# EasyEDA schematic SCH_water_2026-10-04.json
TITLE: Sheet_1; REV: 1.0; Date: 2026-01-22; Sheet: 1/1; Drawn By: asfadfs; Company: Your Company
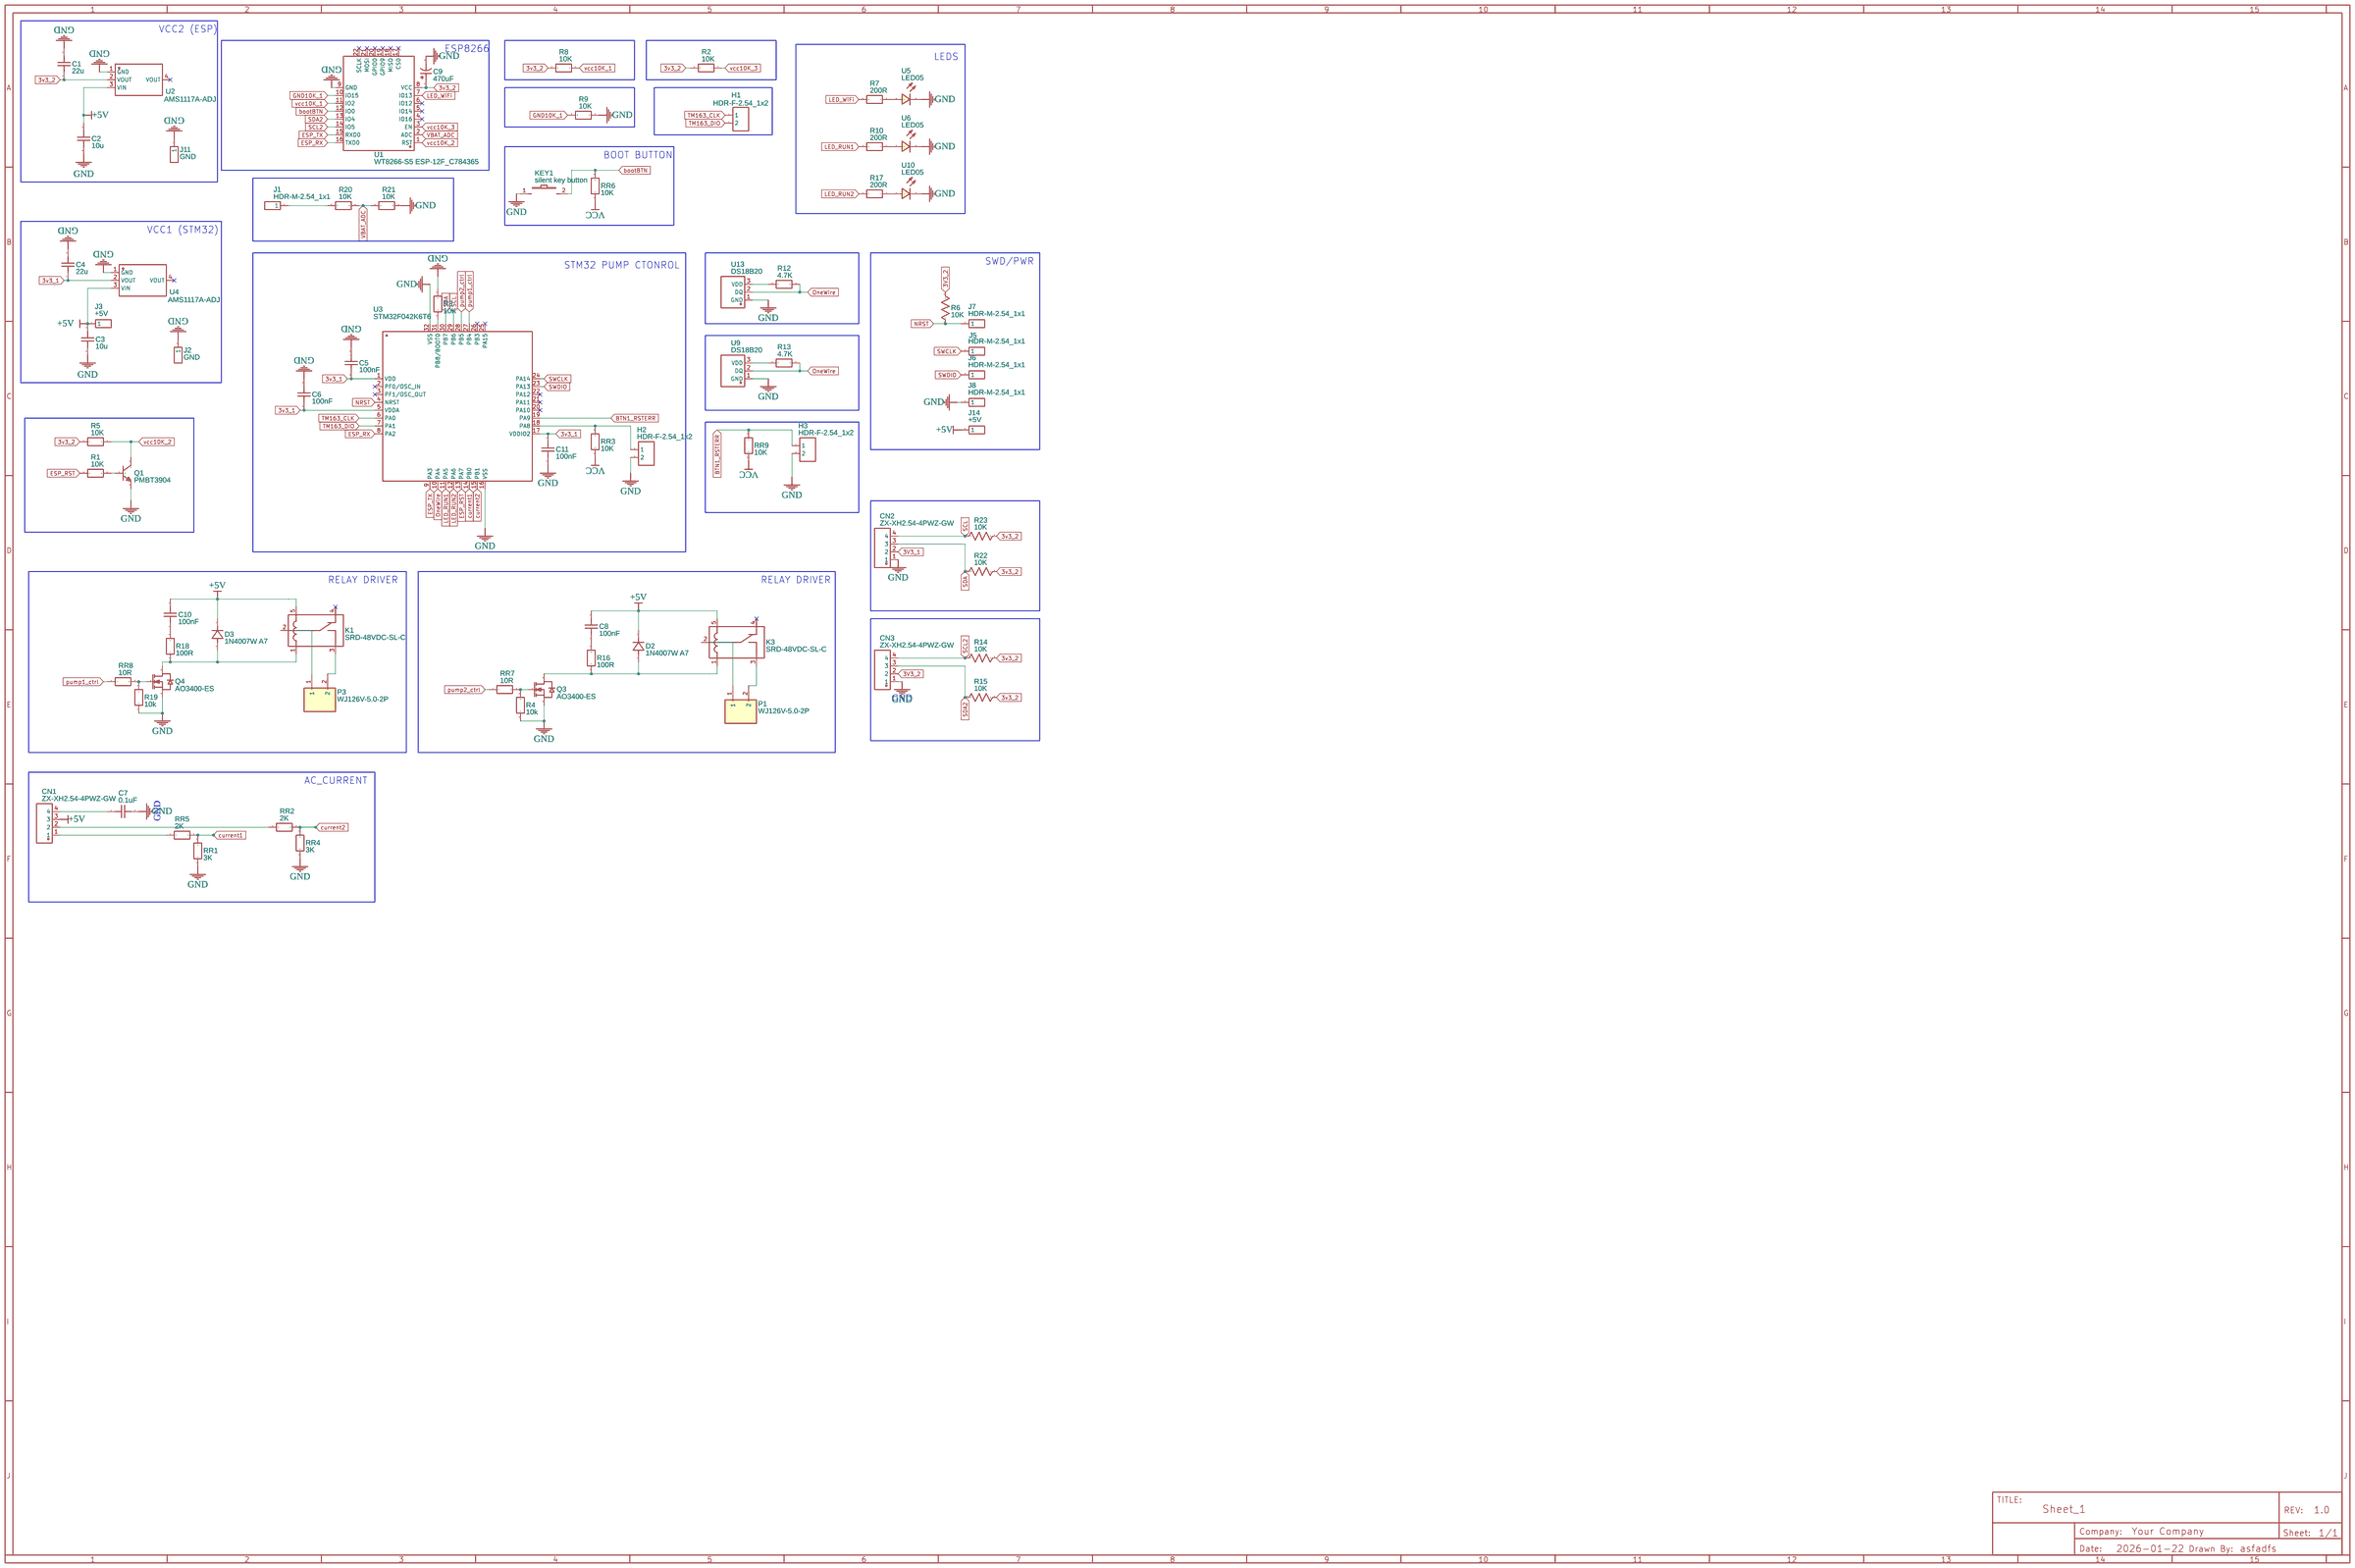
[diagram p0: schematic sheet]

## Parts
C1  22u  [C0603]
C2  10u  [C0603]
C3  10u  [C0603]
C4  22u  [C0603]
C5  100nF  [C0603]
C6  100nF  [C0603]
C7  0.1uF  [C0603]
C8  100nF  [C0603]
C9  470uF  [CAP-TH_BD8.0-P3.50-D0.5-FD_470UF25VF140KM]
C10  100nF  [C0603]
C11  100nF  [C0603]
CN1  ZX-XH2.54-4PWZ-GW  [CONN-TH_4P-P2.50_ZX-XH2.54-4PWZ-Y]
CN2  ZX-XH2.54-4PWZ-GW  [CONN-TH_4P-P2.50_ZX-XH2.54-4PWZ-Y]
CN3  ZX-XH2.54-4PWZ-GW  [CONN-TH_4P-P2.50_ZX-XH2.54-4PWZ-Y]
D2  1N4007W A7  [SOD-123_L2.8-W1.8-LS3.7-RD-3]
D3  1N4007W A7  [SOD-123_L2.8-W1.8-LS3.7-RD-3]
H1  HDR-F-2.54_1x2  [HDR-F-2.54_1X2]
H2  HDR-F-2.54_1x2  [HDR-F-2.54_1X2]
H3  HDR-F-2.54_1x2  [HDR-F-2.54_1X2]
J1  HDR-M-2.54_1x1  [HDR-M-2.54_1X1]
J2  GND  [HDR-M-2.54_1X1]
J3  +5V  [HDR-M-2.54_1X1]
J5  HDR-M-2.54_1x1  [HDR-M-2.54_1X1]
J6  HDR-M-2.54_1x1  [HDR-M-2.54_1X1]
J7  HDR-M-2.54_1x1  [HDR-M-2.54_1X1]
J8  HDR-M-2.54_1x1  [HDR-M-2.54_1X1]
J11  GND  [HDR-M-2.54_1X1]
J14  +5V  [HDR-M-2.54_1X1]
K1  SRD-48VDC-SL-C  [RELAY-TH_SRD-48VDC-SL-C]
K3  SRD-48VDC-SL-C  [RELAY-TH_SRD-48VDC-SL-C]
KEY1  silent key button  [KEY-SMD_L6.0-W6.0-LS6.6]
P1  WJ126V-5.0-2P  [CONN-TH_WJ126V-5.0-2P]
P3  WJ126V-5.0-2P  [CONN-TH_WJ126V-5.0-2P]
Q1  PMBT3904  [SOT-23-3_L2.9-W1.3-P1.90-LS2.4-BR]
Q3  AO3400-ES  [SOT-23-3_L2.9-W1.3-P1.90-LS2.4-BR]
Q4  AO3400-ES  [SOT-23-3_L2.9-W1.3-P1.90-LS2.4-BR]
R1  10K  [R0603]
R2  10K  [R0603]
R3  10K  [R0603]
R4  10k  [R0603]
R5  10K  [R0603]
R6  10K  [R0603]
R7  200R  [R0603]
R8  10K  [R0603]
R9  10K  [R0603]
R10  200R  [R0603]
R12  4.7K  [R0603]
R13  4.7K  [R0603]
R14  10K  [R0603]
R15  10K  [R0603]
R16  100R  [R0603]
R17  200R  [R0603]
R18  100R  [R0603]
R19  10k  [R0603]
R20  10K  [R0603]
R21  10K  [R0603]
R22  10K  [R0603]
R23  10K  [R0603]
RR1  3K  [R0603]
RR2  2K  [R0603]
RR3  10K  [R0603]
RR4  3K  [R0603]
RR5  2K  [R0603]
RR6  10K  [R0603]
RR7  10R  [R0603]
RR8  10R  [R0603]
RR9  10K  [R0603]
U1  WT8266-S5 ESP-12F_C784365  [WIRELM-SMD_WT8266-S5-ESP-12F]
U2  AMS1117A-ADJ  [SOT-223_L6.3-W3.5-P2.30-LS7.0-BR]
U3  STM32F042K6T6  [LQFP-32_L7.0-W7.0-P0.80-LS9.0-BL]
U4  AMS1117A-ADJ  [SOT-223_L6.3-W3.5-P2.30-LS7.0-BR]
U5  LED05  [LED-TH_LED-3MM_RED]
U6  LED05  [LED-TH_LED-3MM_RED]
U9  DS18B20  [TO-92-3_L4.9-W3.7-P2.54-L]
U10  LED05  [LED-TH_LED-3MM_RED]
U13  DS18B20  [TO-92-3_L4.9-W3.7-P2.54-L]

## Library data of the parts
C1-C8 C10 C11 = C_0603_US: Contributor: LCEDA_Lib
C9 = 470UF25VF140KM: Supplier: LCSC; Supplier Part: C46867098; Manufacturer: Econd(米朗电子); Contributor: lcsc; JLCPCB Part Class: Extended Part
CN1-CN3 = ZX-XH2.54-4PWZ-GW: Supplier: LCSC; Supplier Part: C42441540; Manufacturer: Megastar(兆星); Contributor: lcsc; JLCPCB Part Class: Extended Part
D2 D3 = 1N4007W A7: Supplier: LCSC; Supplier Part: C2857183; Manufacturer: JSMSEMI(杰盛微); JLCPCB Part Class: Extended Part; Contributor: lcsc
H1-H3 = HDR-F-2.54_1x2: Supplier Part: C49661; Supplier: LCSC; Contributor: LCEDA_Lib
J1-J3 J5-J8 J11 J14 = HDR-M-2.54_1x1: Supplier Part: C81276; Supplier: LCSC; Contributor: LCEDA_Lib
K1 K3 = SRD-48VDC-SL-C: Contributor: LCSC; Supplier: LCSC; Supplier Part: C490149; Manufacturer: 松乐; JLCPCB Part Class: Extended Part
KEY1 = 6*6*5 Silicone silent key button: Supplier Part: C61120; Supplier: LCSC; Manufacturer: ReliaPro; JLCPCB Part Class: Extended Part
P1 P3 = WJ126V-5.0-2P: Supplier: LCSC; Manufacturer: KANGNEX(康奈克斯电气); Supplier Part: C8404; JLCPCB Part Class: Extended Part
Q1 = PMBT3904: Supplier: LCSC; Supplier Part: C5278868; Manufacturer: PAKER(派克微); Contributor: lcsc; JLCPCB Part Class: Extended Part
Q3 Q4 = AO3400-ES: Supplier: LCSC; Supplier Part: C41365197; Manufacturer: ElecSuper(静芯); Contributor: lcsc
R1-R5 R7-R10 R12 R13 R16-R21 RR1-RR9 = R_0603_EU: Contributor: LCEDA_Lib
R6 R14 R15 R22 R23 = R_0603_US: Contributor: LCEDA_Lib
U1 = WT8266-S5 ESP-12F_C784365: Contributor: LCSC; Supplier: LCSC; Supplier Part: C784365; Manufacturer: Wireless-tag(启明云端); Manufacturer Part: WT8266-S5 ESP-12F; JLCPCB Part Class: Extended Part
U2 U4 = AMS1117A-ADJ: Contributor: lcsc; Supplier: LCSC; Supplier Part: C2984864; Manufacturer: HX(恒佳兴); JLCPCB Part Class: Extended Part
U3 = STM32F042K6T6: Supplier: LCSC; Manufacturer: ST(意法半导体); Supplier Part: C69216; JLCPCB Part Class: Extended Part
U5 U6 U10 = LED05-红灯: Contributor: LCSC; Supplier: LCSC; Supplier Part: C9900009041; Manufacturer: null; JLCPCB Part Class: Extended Part
U9 U13 = DS18B20+T&amp;R: Contributor: LCSC; Supplier: LCSC; Supplier Part: C880672; Manufacturer: ADI(亚德诺)/MAXIM(美信); Manufacturer Part: DS18B20+T&R; JLCPCB Part Class: Extended Part

## Nets
3v3_1: C4.1 C5.1 C6.1 C11.1 U3.1(VDD) U3.5(VDDA) U3.17(VDDIO2) U4.2(VOUT)
3V3_1: CN2.2
3v3_2: C1.1 C9.1 R2.2 R5.2 R8.2 R14.2 R15.2 R22.1 R23.2 U1.8(VCC) U2.2(VOUT)
3V3_2: CN3.2 R6.2
+5V: C2.1 C3.1 C8.1 C10.1 CN1.3 D2.1(C) D3.1(C) J3.1 J14.1 K1.5 K3.5 U2.3(VIN) U4.3(VIN)
GND: C1.2 C2.2 C3.2 C4.2 C5.2 C6.2 C7.2 C9.2 C11.2 CN2.1 CN3.1 H2.2 H3.2 J2.1 J8.1 J11.1 KEY1.1 Q1.2(E) Q3.2(S) Q4.2(S) R3.1 R4.1 R9.1 R19.1 R21.1 RR1.1 RR4.1 U1.9(GND) U2.1(GND) U3.16(VSS) U3.32(VSS) U4.1(GND) U5.2 U6.2 U9.1(GND) U10.2 U13.1(GND)
GND10K_1: R9.2 U1.10(IO15)
VBAT_ADC: R20.1 R21.2 U1.2(ADC)
VCC: RR3.1 RR6.1 RR9.1
vcc10K_1: R8.1 U1.11(IO2)
vcc10K_2: Q1.3(C) R5.1 U1.1(RST)
vcc10K_3: R2.1 U1.3(EN)
bootBTN: KEY1.2 RR6.2 U1.12(IO0)
BTN1_RSTERR: H3.1 RR9.2 U3.19(PA9)
current1: RR1.2 RR5.2 U3.14(PB0)
current2: RR2.2 RR4.2 U3.15(PB1)
ESP_RST: R1.2 U3.13(PA7)
ESP_RX: U1.16(TXD0) U3.8(PA2)
ESP_TX: U1.15(RXD0) U3.9(PA3)
LED_RUN1: R10.2 U3.11(PA5)
LED_RUN2: R17.2 U3.12(PA6)
LED_WiFi: R7.2 U1.7(IO13)
NRST: J7.1 R6.1 U3.4(NRST)
OneWire: R12.1 R13.1 U3.10(PA4) U9.2(DQ) U13.2(DQ)
pump1_ctrl: RR8.1 U3.27(PB4)
pump2_ctrl: RR7.1 U3.28(PB5)
SCL: CN2.4 R23.1 U3.29(PB6)
SCL2: CN3.4 R14.1 U1.14(IO5)
SDA: CN2.3 R22.2 U3.30(PB7)
SDA2: CN3.3 R15.1 U1.13(IO4)
SWCLK: J5.1 U3.24(PA14)
SWDIO: J6.1 U3.23(PA13)
TM163_CLK: H1.1 U3.6(PA0)
TM163_DIO: H1.2 U3.7(PA1)
Net-(C7-1): C7.1 CN1.4
Net-(C8-2): C8.2 R16.2
Net-(C10-2): C10.2 R18.2
Net-(CN1-1): CN1.1 RR5.1
Net-(CN1-2): CN1.2 RR2.1
Net-(D2-2): D2.2(A) K3.1 Q3.3(D) R16.1
Net-(D3-2): D3.2(A) K1.1 Q4.3(D) R18.1
Net-(H2-1): H2.1 RR3.2 U3.18(PA8)
Net-(J1-1): J1.1 R20.2
Net-(K1-2): K1.2 P3.1
Net-(K1-3): K1.3 P3.2
Net-(K3-2): K3.2 P1.1
Net-(K3-3): K3.3 P1.2
Net-(Q1-1): Q1.1(B) R1.1
Net-(Q3-1): Q3.1(G) R4.2 RR7.2
Net-(Q4-1): Q4.1(G) R19.2 RR8.2
Net-(R3-2): R3.2 U3.31(PB8/BOOT0)
Net-(R7-1): R7.1 U5.1
Net-(R10-1): R10.1 U6.1
Net-(R12-2): R12.2 U13.3(VDD)
Net-(R13-2): R13.2 U9.3(VDD)
Net-(R17-1): R17.1 U10.1

Not connected (* = marked no-connect by the designer): K1 4*; K3 4*; U1 4(IO16)* 5(IO14)* 6(IO12)* 17(CS0)* 18(MISO)* 19(GPIO9)* 20(GPIO0)* 21(MOSI)* 22(SCLK)*; U2 4(VOUT)*; U3 2(PF0/OSC_IN)* 3(PF1/OSC_OUT)* 20(PA10)* 21(PA11)* 22(PA12)* 25(PA15)* 26(PB3)*; U4 4(VOUT)*

## Notes on the sheet
- VCC2 (ESP)
- ESP8266
- LEDS
- BOOT BUTTON
- VCC1 (STM32)
- SWD/PWR
- STM32 PUMP CTONROL
- RELAY DRIVER
- RELAY DRIVER
- GND
- AC_CURRENT
- GND
